# EasyEDA Pro project 6.26TI主控板.epro

# Schematic Schematic1
Board Name: Board1; Create Date: 2025-06-26; Page Name: P1; Project Name: 电赛国赛TI车; Schematic Name: Schematic1; Update Date: 2025-06-26; Company: 嘉立创EDA; Page Size: A4; Version: V1.0
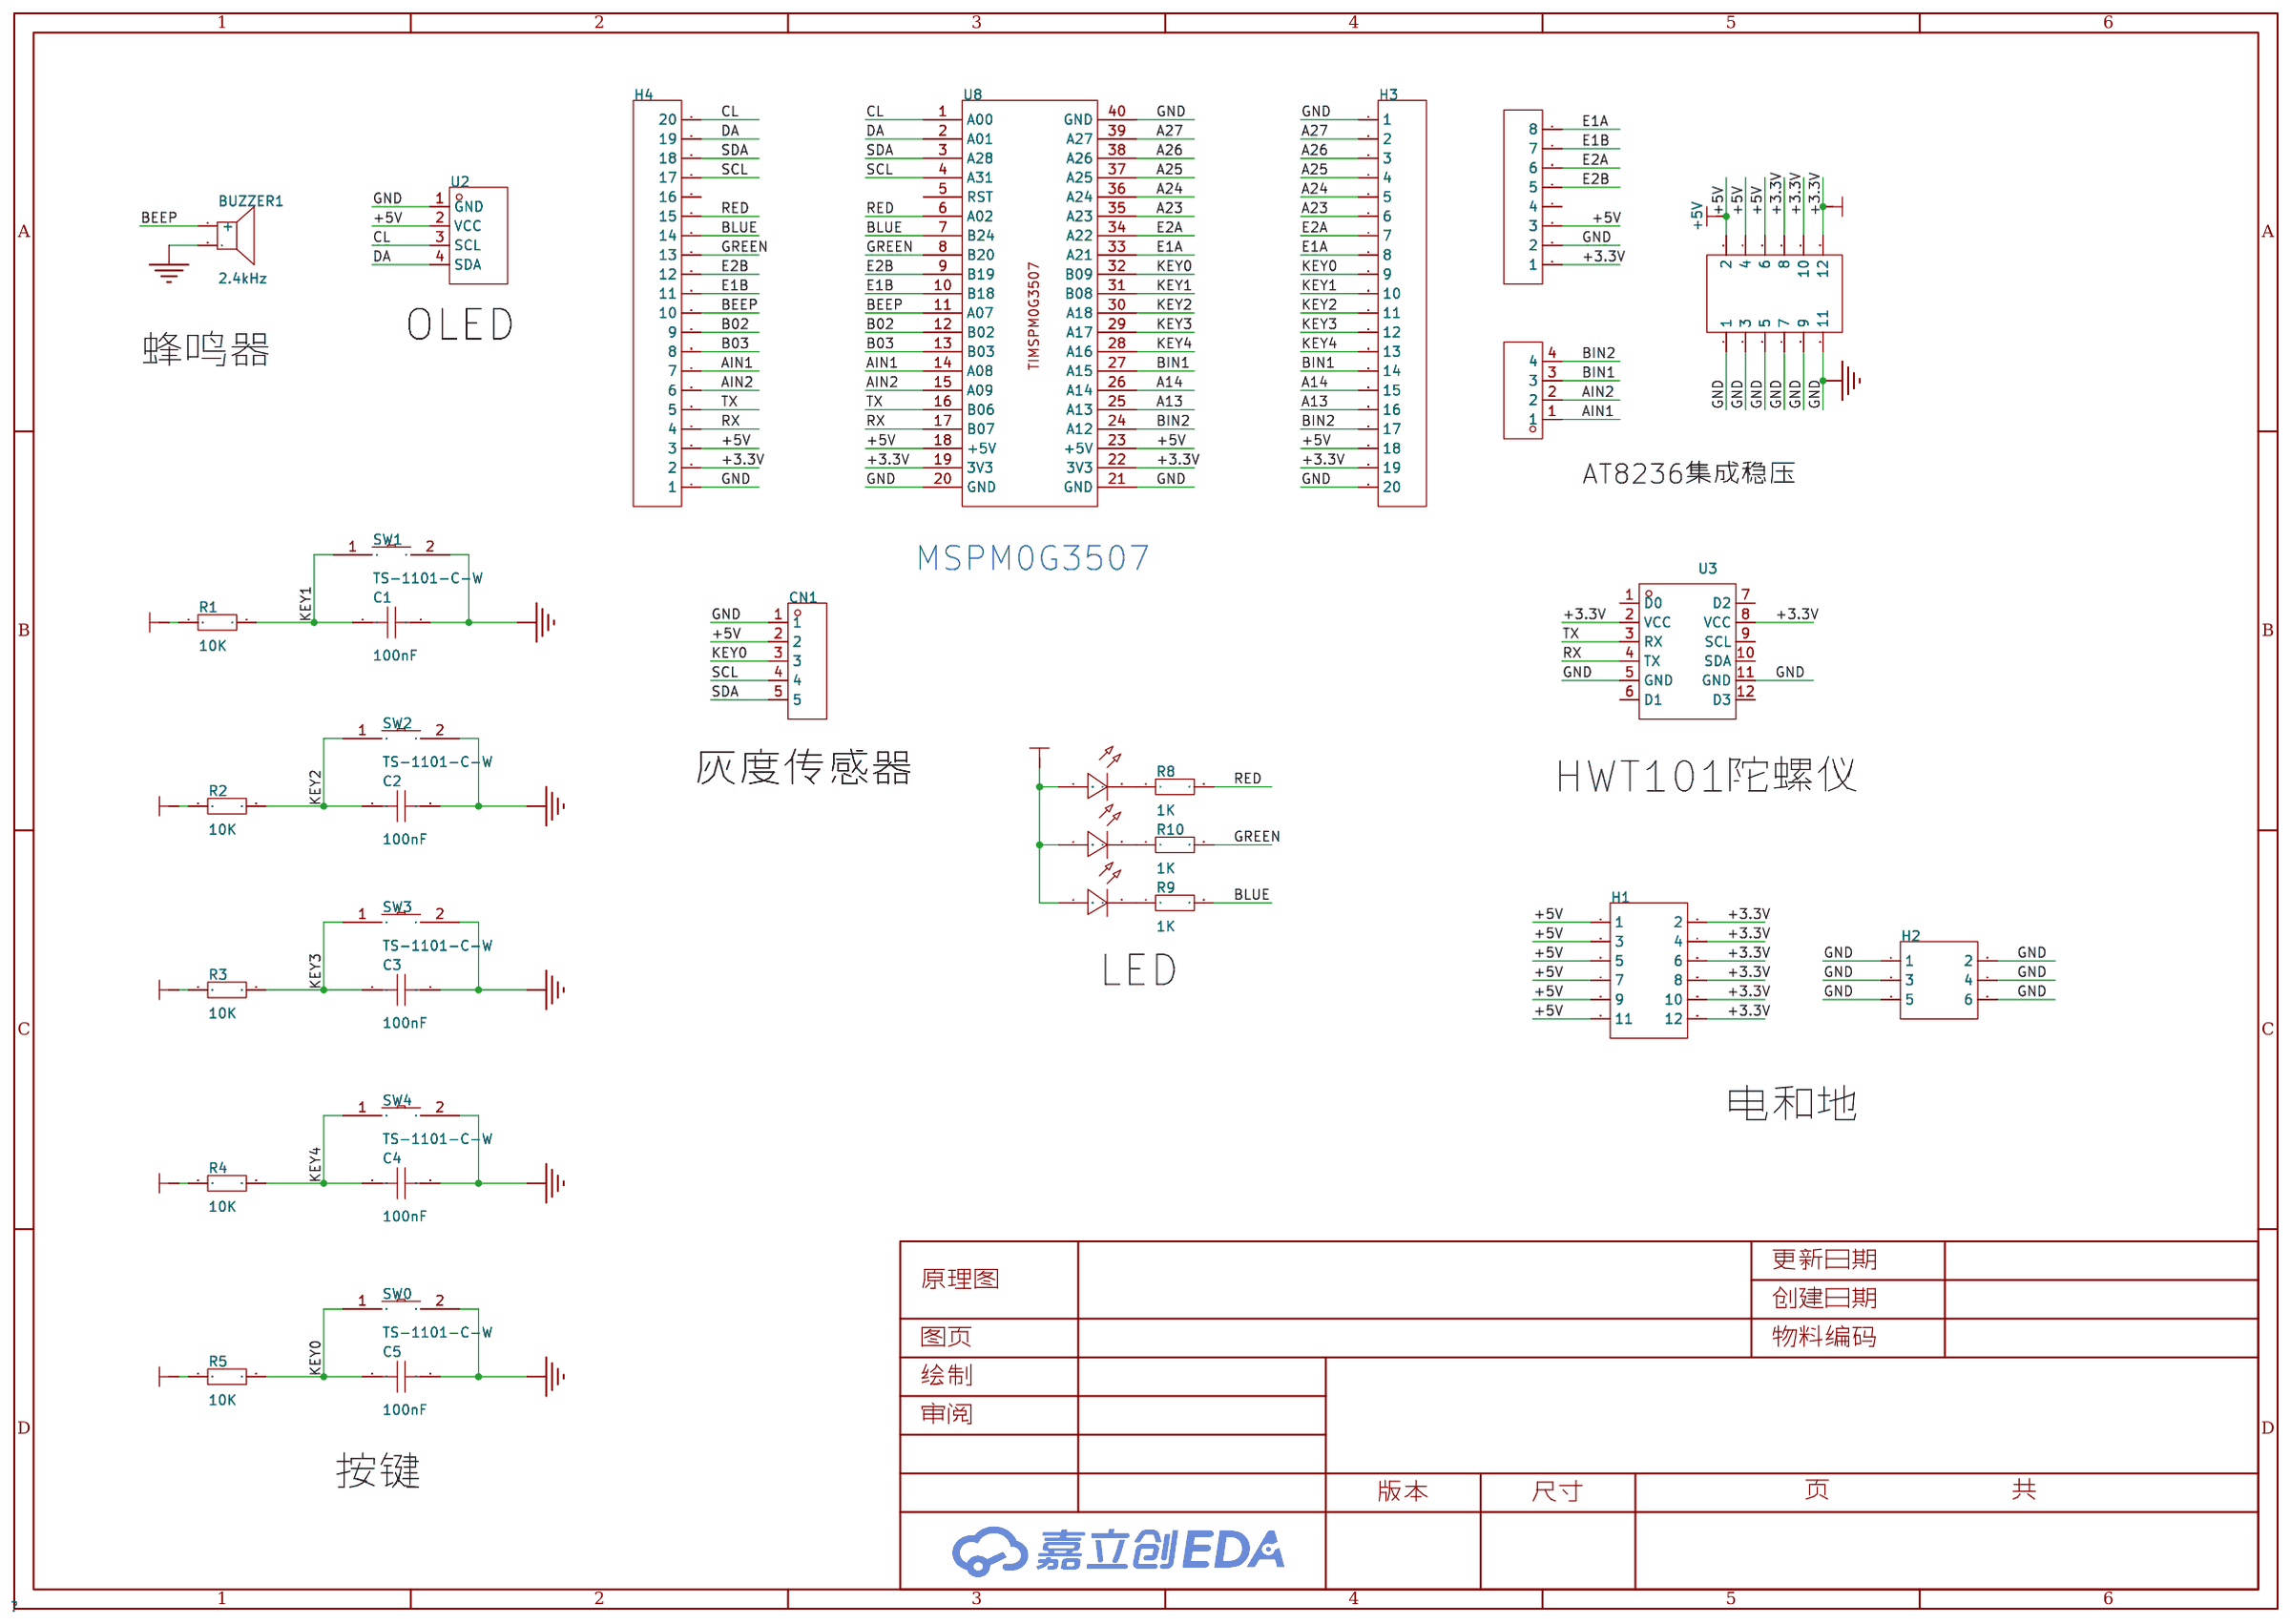
[diagram p0: schematic sheet]

## Parts
AT82361p4  -  [HDR-TH_4P-P2.54-V-F]
AT82362p6  -  [HDR-TH_12P-P2.54-V-M-R2-C6-S2.54]
BUZZER1  2.4kHz  [BUZ-TH_BD12.0-P7.60-D0.6-FD]
C1  100nF  [C0805]
C2  100nF  [C0805]
C3  100nF  [C0805]
C4  100nF  [C0805]
C5  100nF  [C0805]
CN1  灰度传感器  [CONN-TH_5P-P2.54_XH-5AW_C2908614]
H1  -  [HDR-TH_12P-P2.54-V-M-R2-C6-S2.54]
H2  -  [HDR-TH_6P-P2.54-V-F-R2-C3-S2.54]
H3  -  [HDR-TH_20P-P2.54-V-F]
H4  -  [HDR-TH_20P-P2.54-V-F]
LED1  -  [LED_TH-3mm]
LED2  -  [LED_TH-3mm]
LED3  -  [LED_TH-3mm]
R1  10K  [R0805]
R2  10K  [R0805]
R3  10K  [R0805]
R4  10K  [R0805]
R5  10K  [R0805]
R8  1K  [R0805_1]
R9  1K  [R0805_1]
R10  1K  [R0805_1]
SW0  TS-1101-C-W  [SW-SMD_L6.0-W3.3-LS8.0]
SW1  TS-1101-C-W  [SW-SMD_L6.0-W3.3-LS8.0]
SW2  TS-1101-C-W  [SW-SMD_L6.0-W3.3-LS8.0]
SW3  TS-1101-C-W  [SW-SMD_L6.0-W3.3-LS8.0]
SW4  TS-1101-C-W  [SW-SMD_L6.0-W3.3-LS8.0]
U2  OLED  [OLED-TH_L27.8-W27.2-P2.54_C9900033791]
U3  -  [HWT101]
U7  -  [HDR-TH_8P-P2.54-V-F-1]
U8  -  [TIMSPM0G3507-MINI]

## Library data of the parts
AT82361p4 = HDR-F_2.54_1x4P: Supplier Part: C2718488; Supplier Footprint: 插件
AT82362p6 H1 = HDR-F_2.54_2x6
BUZZER1 = TMB12A05_C96093: 驱动方式:有源(内含驱动线路);构造类型:电磁式;额定电压:-;频率:2.4kHz;声压(SPL):85dB;; LCSC Part Name: TMB12A05; Supplier Part: C96093; Manufacturer: 华能; Manufacturer Part: TMB12A05; Supplier Footprint: 插件,D=12mm; JLCPCB Part Class: 扩展库; Datasheet: https://atta.szlcsc.com/upload/public/pdf/source/20241025/8A17FE04D767D19A35A06DEF9A82AB1E.pdf; Supplier: LCSC; Driver Circuitry: 有源(内含驱动线路); Technology: 电磁式; Voltage - Supply: 4V~8V; Sound Pressure Level(SPL): 85dB; Diameter(φD): 12mm; Height: 9.8mm
C1-C5 = CAP_0805: Supplier Footprint: 0805
CN1 = XH-5AW: 插针结构:1x5P;间距:2.54mm;安装方式:弯插;参考系列:XH;总PIN数:5P;排数:1;每排PIN数:5;行距:-;额定电流:3A;触头材质:黄铜;触头镀层:锡;工作温度范围:-25℃~+85℃;; LCSC Part Name: 1x5P 间距:2.54mm 弯插 系列:XH; Supplier Part: C2908614; Manufacturer: HCTL(华灿天禄); Supplier Footprint: 弯插,P=2.5mm; JLCPCB Part Class: 扩展库; Datasheet: https://atta.szlcsc.com/upload/public/pdf/source/20230711/B565BAF3B11666EF6B81B3605408F2BD.pdf; Supplier: LCSC; Pins Structure: 1x5P; Pitch: 2.54mm; Mounting Style: 弯插; Reference Series: XH; Number of Pins: 5P; Number of Rows: 1; Number of PINs Per Row: 5; Current Rating (Max): 3A; Contact Material: 黄铜; Contact Plating: 锡; Operating Temperature Range: -25℃~+85℃
H2 = HDR-F_2.54_2x3: Supplier Part: C92272; Supplier Footprint: 插件
H3 H4 = HDR-F_2.54_1x20P: Supplier Part: C50984; Supplier Footprint: 插件
LED1 = LED_TH-R_3mm: Supplier Footprint: 插件
LED2 = LED_TH-G_3mm: Supplier Footprint: 插件
LED3 = LED_TH-B_3mm: Supplier Footprint: 插件
R1-R5 = Res_0805: Supplier Footprint: 0805
R8-R10 = Res_0603: Supplier Footprint: 0603
SW0-SW4 = TS-1101-C-W: 电路结构:单刀单掷;按钮形状:矩形按钮;作用力:260gf;安装方式:立贴;开关长度:6mm;开关宽度:3.6mm;开关高度:2.5mm;带支架:不带;触点电流:50mA;额定电压(AC):-;额定电压(DC):12V;额定功率:-;绝缘电阻:-;带灯:无;机械寿命:5万次;; LCSC Part Name: 6*3.6*2.5mm 立贴 轻触开关; Supplier Part: C318938; Manufacturer: XKB Connectivity(中国星坤); Supplier Footprint: SMD; JLCPCB Part Class: 扩展库; Datasheet: https://atta.szlcsc.com/upload/public/pdf/source/20200227/C318938_C2E53B1EEDE37D980A33616AC086DE53.pdf; Supplier: LCSC; Circuit: 单刀单掷; Actuator Style: 矩形按钮; Operating Force: 260gf; Mounting Style: 立贴; Switch Length: 6mm; Switch Width: 3.6mm; Switch Height: 2.5mm; Strike Gundam: 不带; Contact Current: 50mA; Voltage Rating (DC): 12V; Actuator/Cap Color: 白色带淡绿; With Lamp: 无; Mechanical Life: 5万次; Operating Temperature: -30℃~+85℃
U2 = HS96L03W2C03: 主控芯片:SSD1315;接口类型:I2C;尺寸(inch):0.96;像素分辨率:128x64;; LCSC Part Name: 0.96寸OLED显示屏窄白光IIC; Supplier Part: C5248080; Manufacturer: HS(汉昇); JLCPCB Part Class: 扩展库; Datasheet: https://atta.szlcsc.com/upload/public/pdf/source/20230627/763D01F79A90007632F098068C7C8AD9.pdf; Supplier: LCSC; Main Control Chip: SSD1315; Interface Type: I2C; Size: 0.96; Pixel Resolution: 128x64; Operating Temperature: -40℃~+70℃
U3 = HWT101: Pin Type: IN
U7 = HDR-F_2.54_1x8P: Supplier Part: C27438; Supplier Footprint: 插件
U8 = TIMSPM0G3507 地猛星: TI控制板卡，MSPM0G3507-地猛星

## Nets
+3.3V: AT82362p6.8 AT82362p6.10 AT82362p6.12 H1.2 H1.4 H1.6 H1.8 H1.10 H1.12 H3.19 H4.2 LED1.1(C) LED2.1(C) LED3.1(C) R1.1 R2.1 R3.1 R4.1 R5.1 U3.2(VCC) U3.8(VCC) U7.1 U8.19(3V3) U8.22(3V3)
+5V: AT82362p6.2 AT82362p6.4 AT82362p6.6 CN1.2 H1.1 H1.3 H1.5 H1.7 H1.9 H1.11 H3.18 H4.3 U2.2(VCC) U7.3 U8.18(+5V) U8.23(+5V)
GND: AT82362p6.1 AT82362p6.3 AT82362p6.5 AT82362p6.7 AT82362p6.9 AT82362p6.11 BUZZER1.2 C1.2 C2.2 C3.2 C4.2 C5.2 CN1.1 H2.1 H2.2 H2.3 H2.4 H2.5 H2.6 H3.1 H3.20 H4.1 SW0.2 SW1.2 SW2.2 SW3.2 SW4.2 U2.1(GND) U3.5(GND) U3.11(GND) U7.2 U8.20(GND) U8.21(GND) U8.40(GND)
A13: H3.16 U8.25(A13)
A14: H3.15 U8.26(A14)
A23: H3.6 U8.35(A23)
A24: H3.5 U8.36(A24)
A25: H3.4 U8.37(A25)
A26: H3.3 U8.38(A26)
A27: H3.2 U8.39(A27)
AIN1: AT82361p4.1 H4.7 U8.14(A08)
AIN2: AT82361p4.2 H4.6 U8.15(A09)
B02: H4.9 U8.12(B02)
B03: H4.8 U8.13(B03)
BEEP: BUZZER1.1(+) H4.10 U8.11(A07)
BIN1: AT82361p4.3 H3.14 U8.27(A15)
BIN2: AT82361p4.4 H3.17 U8.24(A12)
BLUE: H4.14 R9.2 U8.7(B24)
CL: H4.20 U2.3(SCL) U8.1(A00)
DA: H4.19 U2.4(SDA) U8.2(A01)
E1A: H3.8 U7.8 U8.33(A21)
E1B: H4.11 U7.7 U8.10(B18)
E2A: H3.7 U7.6 U8.34(A22)
E2B: H4.12 U7.5 U8.9(B19)
GREEN: H4.13 R10.2 U8.8(B20)
KEY0: C5.1 CN1.3 H3.9 R5.2 SW0.1 U8.32(B09)
KEY1: C1.1 H3.10 R1.2 SW1.1 U8.31(B08)
KEY2: C2.1 H3.11 R2.2 SW2.1 U8.30(A18)
KEY3: C3.1 H3.12 R3.2 SW3.1 U8.29(A17)
KEY4: C4.1 H3.13 R4.2 SW4.1 U8.28(A16)
RED: H4.15 R8.2 U8.6(A02)
RX: H4.4 U3.4(TX) U8.17(B07)
SCL: CN1.4 H4.17 U8.4(A31)
SDA: CN1.5 H4.18 U8.3(A28)
TX: H4.5 U3.3(RX) U8.16(B06)
Net-(LED1-2): LED1.2(A) R8.1
Net-(LED2-2): LED2.2(A) R10.1
Net-(LED3-2): LED3.2(A) R9.1

Not connected (* = marked no-connect by the designer): H4 16; U3 1(D0) 6(D1) 7(D2) 9(SCL) 10(SDA) 12(D3); U7 4; U8 5(RST)

## Notes on the sheet
- 蜂鸣器
- AT8236集成稳压
- MSPM0G3507
- HWT101陀螺仪
- LED
- 电和地
- 按键

# Board PCB1
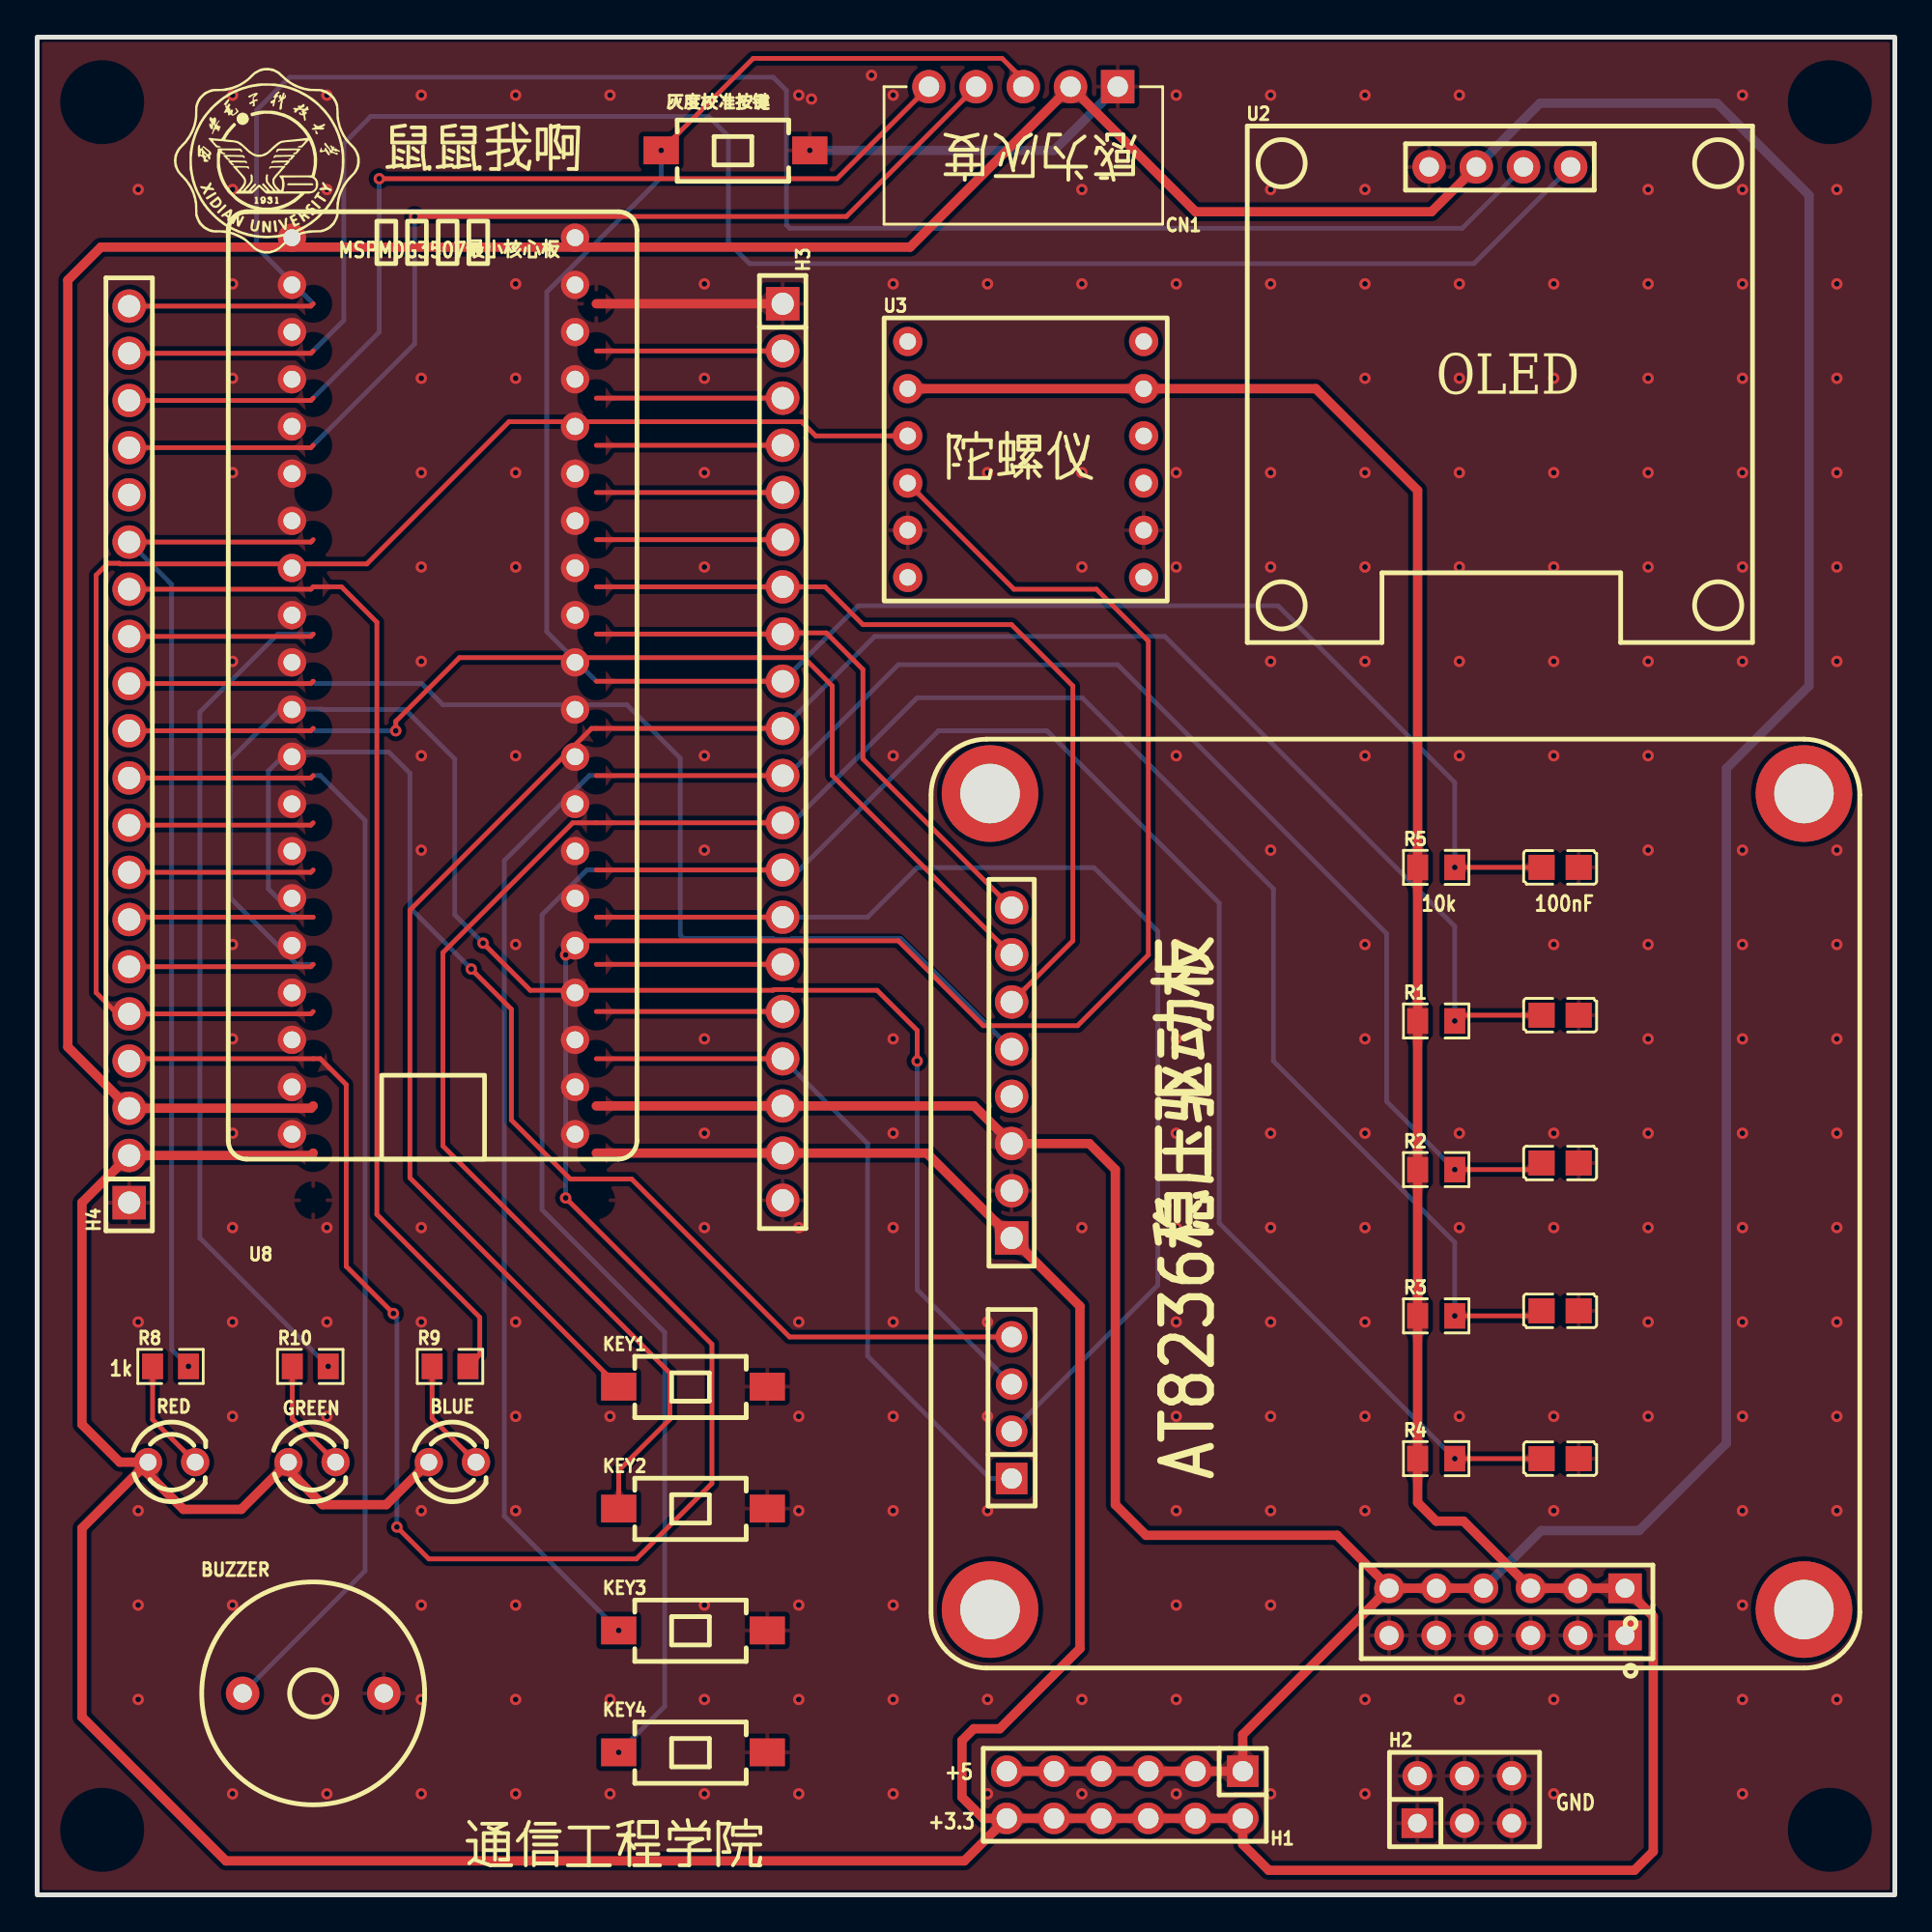
[diagram p1: board, top side]
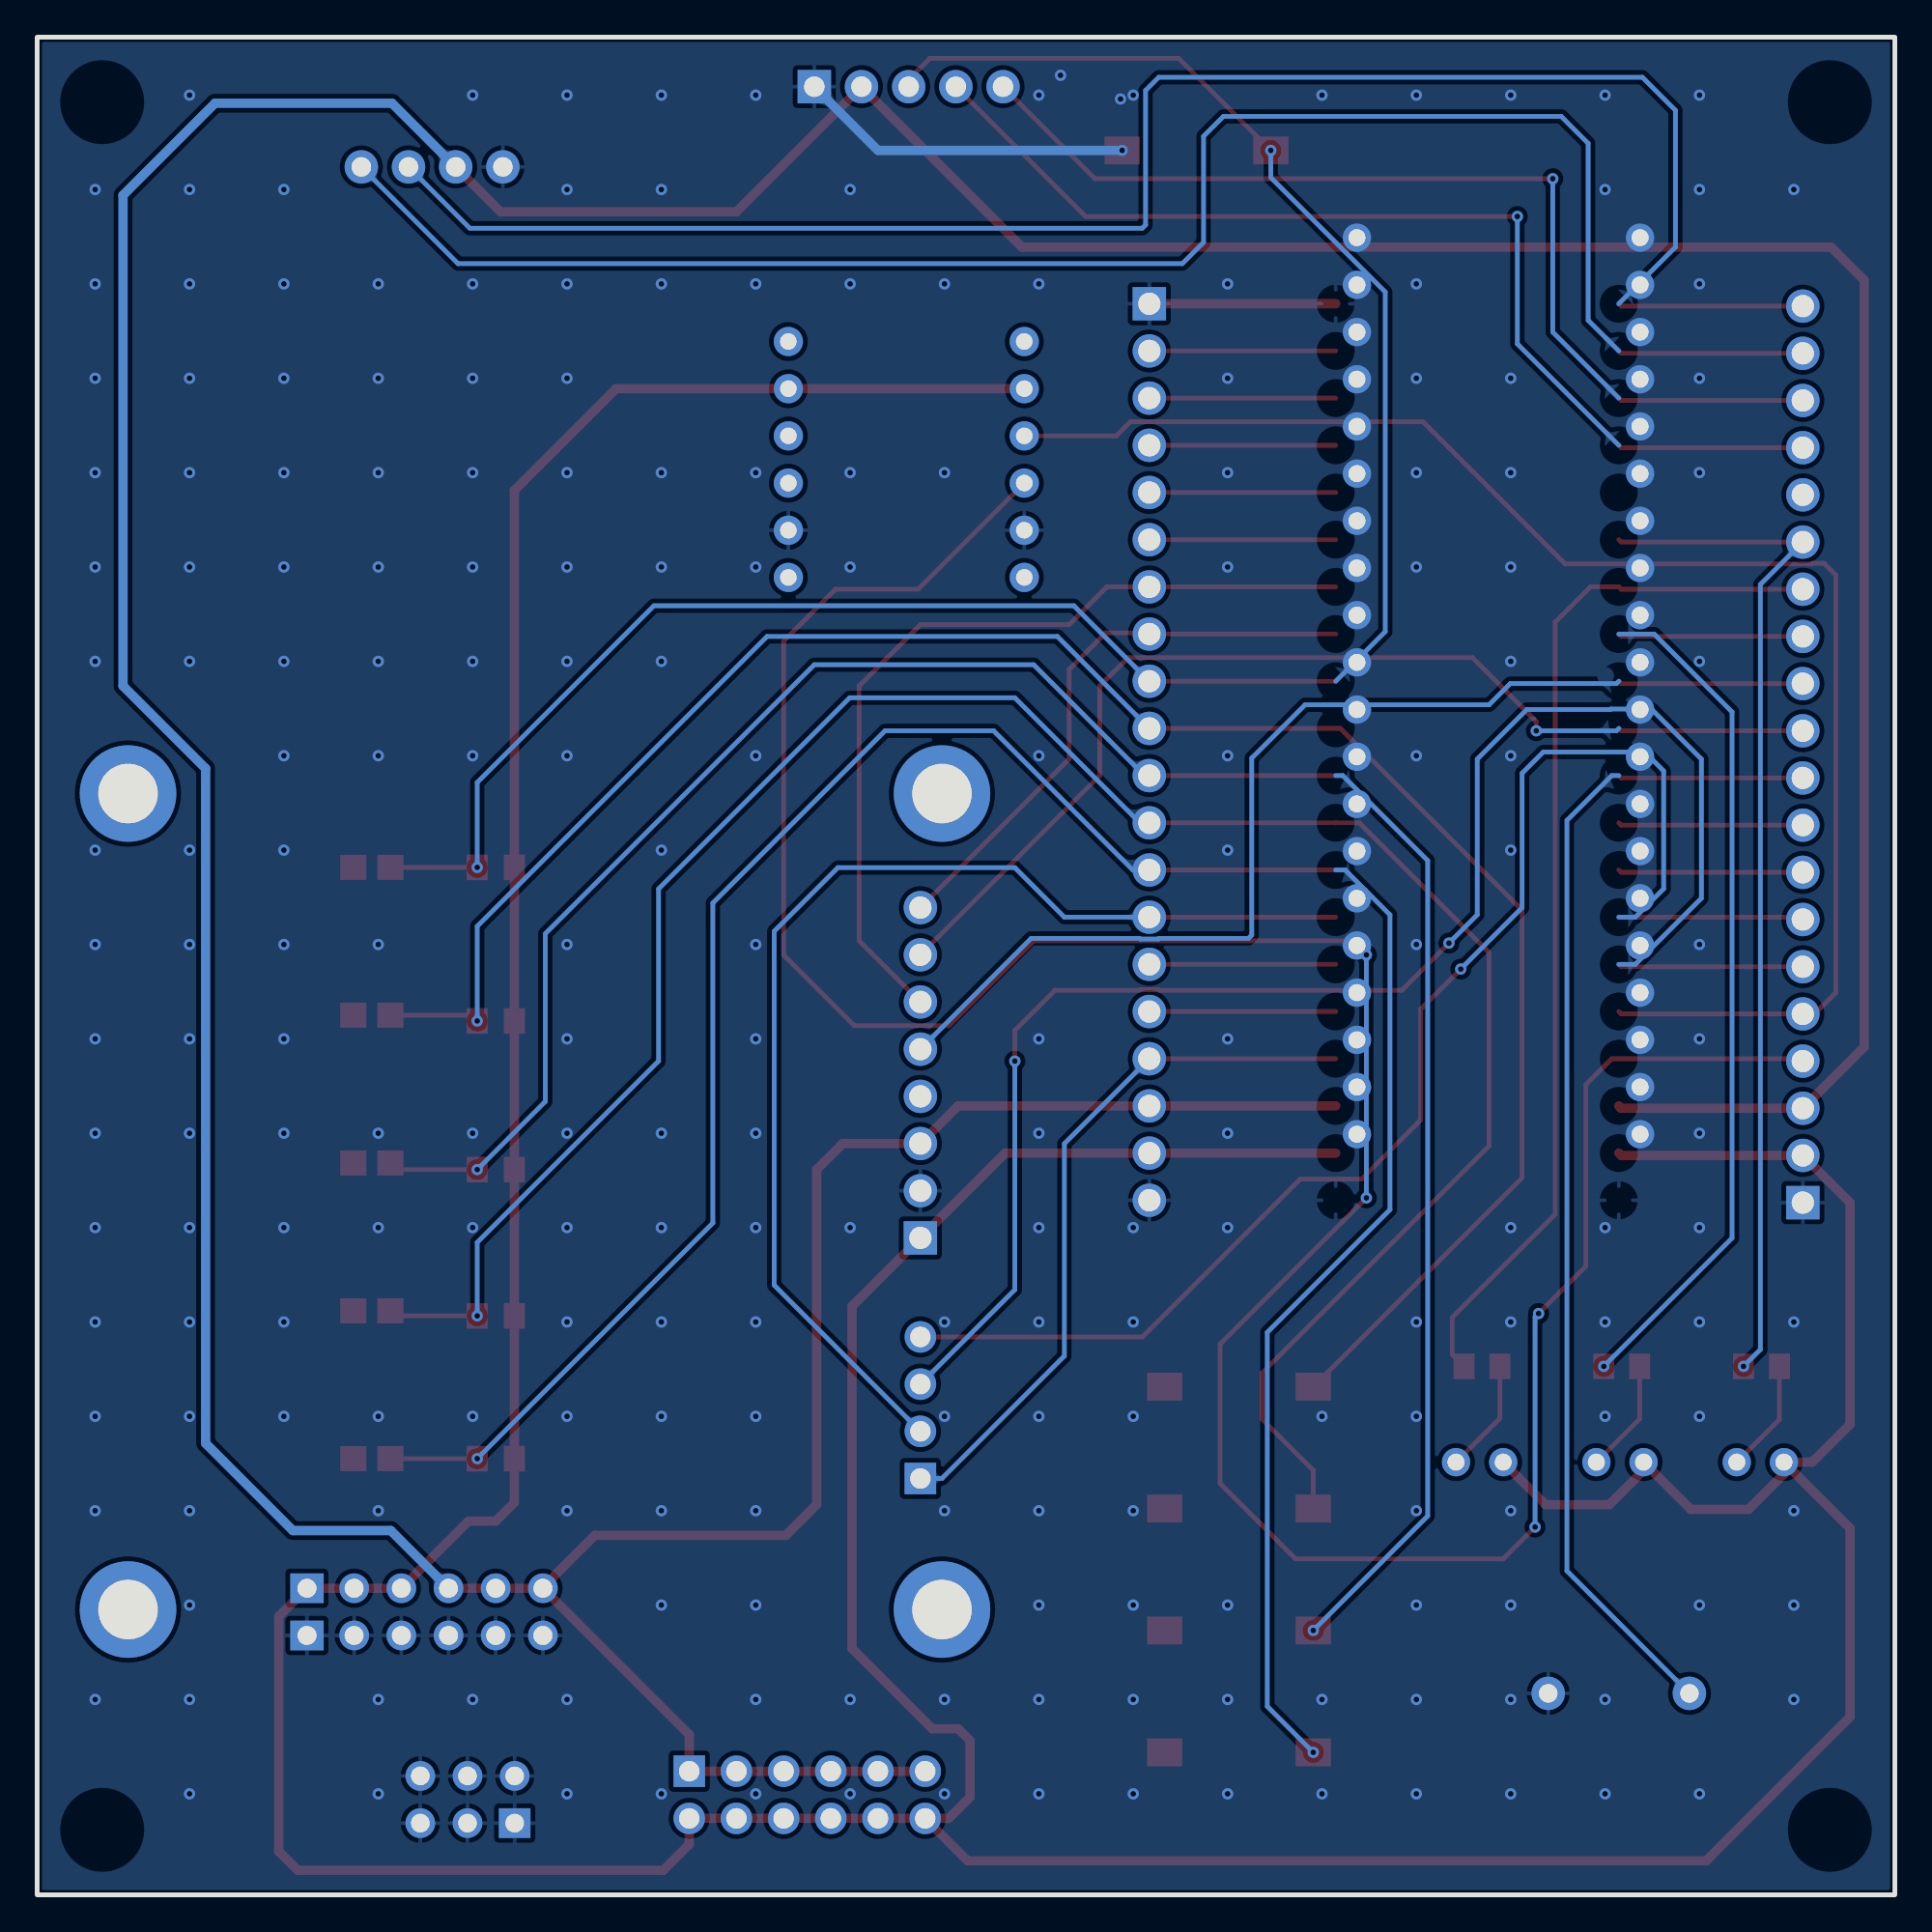
[diagram p2: board, bottom side, seen from below]

Outline 100 x 100 mm; copper layers: Top Layer, Bottom Layer. Coordinates in mm from the lower left corner of the outline.
Outline path: rectangle 0,100 100,0
Stack: Top Layer 0.035mm / Dielectric1 1.51mm FR4 er 4.5 / Bottom Layer 0.035mm

## Design rules (mm)
template: JLCPCB Capability(Two Layers Board)
spacing copperThickness1oz (default): track to track 0.102, other pairs 0.152 to 0.3
spacing copperThickness2oz: track to track 0.203, other pairs 0.152 to 0.3
track width copperThickness1oz (default): min 0.127, default 0.254, max 2.54
track width copperThickness2oz: min 0.203, default 0.254, max 2.54
differential pair differentialPair (default): width min 0.127, default 0.254, max 2.54; gap min 0.152, default 0.152
via viaSize (default): diameter min 0.5, default 0.61, max 10; hole min 0.3, default 0.305, max 6.3

## Placement (name value [footprint] x y rotation side)
BLUE  -  [LED_TH-3mm]  22.35 23.29 0 top
BUZZER  2.4kHz  [BUZ-TH_BD12.0-P7.60-D0.6-FD]  14.86 10.85 0 top
C1  100nF  [C0805]  81.98 47.35 0 top
C2  100nF  [C0805]  81.98 39.39 0 top
C3  100nF  [C0805]  81.98 31.44 0 top
C4  100nF  [C0805]  81.98 23.48 0 top
C5  100nF  [C0805]  81.98 55.31 0 top
CN1  灰度传感器  [CONN-TH_5P-P2.54_XH-5AW_C2908614]  53.09 97.33 180 top
GREEN  -  [LED_TH-3mm]  14.8 23.29 0 top
H1  -  [HDR-TH_12P-P2.54-V-M-R2-C6-S2.54]  58.55 5.38 180 top
H2  -  [HDR-TH_6P-P2.54-V-F-R2-C3-S2.54]  76.84 5.13 0 top
H3  -  [HDR-TH_20P-P2.54-V-F]  40.13 61.52 270 top
H4  -  [HDR-TH_20P-P2.54-V-F]  4.95 61.39 90 top
H20  -  [HDR-TH_8P-P2.54-V-F-1]  52.46 44.25 90 top
H21  -  [HDR-TH_4P-P2.54-V-F]  52.46 26.22 90 top
H22  -  [HDR-TH_6P-P2.54-V-F]  79.13 13.96 180 top
H23  -  [HDR-TH_6P-P2.54-V-F]  79.13 16.5 180 top
KEY1  TS-1101-C-W  [SW-SMD_L6.0-W3.3-LS8.0]  35.31 27.36 0 top
KEY2  TS-1101-C-W  [SW-SMD_L6.0-W3.3-LS8.0]  35.31 20.79 0 top
KEY3  TS-1101-C-W  [SW-SMD_L6.0-W3.3-LS8.0]  35.31 14.23 0 top
KEY4  TS-1101-C-W  [SW-SMD_L6.0-W3.3-LS8.0]  35.31 7.67 0 top
R1  10K  [R0805]  75.31 47.04 0 top
R2  10K  [R0805]  75.31 39.04 0 top
R3  10K  [R0805]  75.31 31.17 0 top
R4  10K  [R0805]  75.31 23.48 0 top
R5  10K  [R0805]  75.31 55.31 0 top
R8  1K  [R0805_1]  7.18 28.45 0 top
R9  1K  [R0805_1]  22.22 28.45 0 top
R10  1K  [R0805_1]  14.7 28.45 0 top
RED  -  [LED_TH-3mm]  7.24 23.29 0 top
SCREW3  -  [M3螺丝]  95.11 59.28 90 top
SCREW5  -  [M3螺丝]  95.11 15.36 90 top
SCREW6  -  [M3螺丝]  51.29 59.28 90 top
SCREW7  -  [M3螺丝]  51.29 15.36 90 top
U2  OLED  [OLED-TH_L27.8-W27.2-P2.54_C9900033791]  78.74 93.02 0 top
U3  -  [HWT101]  53.21 77.27 0 top
U8  -  [TIMSPM0G3507-MINI]  22.48 61.52 0 top
灰度校准按键  TS-1101-C-W  [SW-SMD_L6.0-W3.3-LS8.0]  37.59 93.9 0 top

## Footprints (pads in the part's own frame, mm; a bottom-side part is the same pattern mirrored in y, then rotated)
BUZ-TH_BD12.0-P7.60-D0.6-FD
  round 1.8 hole 1: 1(-3.8,0) 2(3.8,0)
C0805
  rect 1.41x1.35 smd: 1(-1,0) 2(1,0)
CONN-TH_5P-P2.54_XH-5AW_C2908614
  rect 1.8x1.8 hole 1.1: 1(-5.08,0)
  round 1.8 hole 1.1: 2(-2.54,0) 3(0,0) 4(2.54,0) 5(5.08,0)
HDR-TH_4P-P2.54-V-F
  rect 1.7x1.7 hole 1.1: 1(-3.81,0)
  round 1.7 hole 1.1: 2(-1.27,0) 3(1.27,0) 4(3.81,0)
HDR-TH_6P-P2.54-V-F
  rect 1.8x1.6 hole 1.02: 1(-6.35,0)
  round 1.6 hole 1.02: 2(-3.81,0) 3(-1.27,0) 4(1.27,0) 5(3.81,0) 6(6.35,0)
HDR-TH_6P-P2.54-V-F-R2-C3-S2.54
  rect 1.7x1.6 hole 1: 1(-2.54,-1.27)
  round 1.6 hole 1: 2(-2.54,1.27) 3(0,-1.27) 4(0,1.27) 5(2.54,-1.27) 6(2.54,1.27)
HDR-TH_8P-P2.54-V-F-1
  rect 1.8x1.8 hole 1.2: 1(-8.89,0)
  round 1.8 hole 1.2: 2(-6.35,0) 3(-3.81,0) 4(-1.27,0) 5(1.27,0) 6(3.81,0) 7(6.35,0) 8(8.89,0)
HDR-TH_12P-P2.54-V-M-R2-C6-S2.54
  rect 1.7x1.7 hole 1.1: 1(-6.35,-1.27)
  round 1.7 hole 1.1: 2(-6.35,1.27) 3(-3.81,-1.27) 4(-3.81,1.27) 5(-1.27,-1.27) 6(-1.27,1.27) 7(1.27,-1.27) 8(1.27,1.27) 9(3.81,-1.27) 10(3.81,1.27) 11(6.35,-1.27) 12(6.35,1.27)
HDR-TH_20P-P2.54-V-F
  rect 1.8x1.8 hole 1.2: 1(-24.13,0)
  round 1.8 hole 1.2: 2(-21.59,0) 3(-19.05,0) 4(-16.51,0) 5(-13.97,0) 6(-11.43,0) 7(-8.89,0) 8(-6.35,0) 9(-3.81,0) 10(-1.27,0) 11(1.27,0) 12(3.81,0) 13(6.35,0) 14(8.89,0) 15(11.43,0) 16(13.97,0) 17(16.51,0) 18(19.05,0) 19(21.59,0) 20(24.13,0)
HWT101
  round 1.575 hole 0.889: 1(-6.35,6.35) 2(-6.35,3.81) 3(-6.35,1.27) 4(-6.35,-1.27) 5(-6.35,-3.81) 6(-6.35,-6.35) 7(6.35,6.35) 8(6.35,3.81) 9(6.35,1.27) 10(6.35,-1.27) 11(6.35,-3.81) 12(6.35,-6.35)
LED_TH-3mm
  round 1.524 hole 0.914: 1(-1.27,0) 2(1.27,0)
M3螺丝
  round 5.2 hole 3.2: 1(0,0)
OLED-TH_L27.8-W27.2-P2.54_C9900033791
  round 1.8 hole 1.05: 1(-3.81,0) 2(-1.27,0) 3(1.27,0) 4(3.81,0)
R0805
  rect 1.133x1.377 smd: 1(-1,0) 2(1,0)
R0805_1
  rect 1.133x1.377 smd: 1(-0.966,0) 2(0.966,0)
SW-SMD_L6.0-W3.3-LS8.0
  rect 1.9x1.5 smd: 1(-4,0) 2(4,0)
TIMSPM0G3507-MINI
  round 1.524 hole 0.914: 1(-8.763,27.686) 2(-8.763,25.146) 3(-8.763,22.606) 4(-8.763,20.066) 5(-8.763,17.526) 6(-8.763,14.986) 7(-8.763,12.446) 8(-8.763,9.906) 9(-8.763,7.366) 10(-8.763,4.826) 11(-8.763,2.286) 12(-8.763,-0.254) 13(-8.763,-2.794) 14(-8.763,-5.334) 15(-8.763,-7.874) 16(-8.763,-10.414) 17(-8.763,-12.954) 18(-8.763,-15.494) 19(-8.763,-18.034) 20(-8.763,-20.574) 21(6.477,-20.574) 22(6.477,-18.034) 23(6.477,-15.494) 24(6.477,-12.954) 25(6.477,-10.414) 26(6.477,-7.874) 27(6.477,-5.334) 28(6.477,-2.794) 29(6.477,-0.254) 30(6.477,2.286) 31(6.477,4.826) 32(6.477,7.366) 33(6.477,9.906) 34(6.477,12.446) 35(6.477,14.986) 36(6.477,17.526) 37(6.477,20.066) 38(6.477,22.606) 39(6.477,25.146) 40(6.477,27.686)

## Nets
+3.3V: BLUE.1 GREEN.1 H1.2 H1.4 H1.6 H1.8 H1.10 H1.12 H3.19 H4.2 H20.1 H23.1 H23.2 H23.3 R1.1 R2.1 R3.1 R4.1 R5.1 RED.1 U3.2 U3.8 U8.19 U8.22
+5V: CN1.2 H1.1 H1.3 H1.5 H1.7 H1.9 H1.11 H3.18 H4.3 H20.3 H23.4 H23.5 H23.6 U2.2 U8.18 U8.23
GND: BUZZER.2 C1.2 C2.2 C3.2 C4.2 C5.2 CN1.1 H2.1 H2.2 H2.3 H2.4 H2.5 H2.6 H3.1 H3.20 H4.1 H20.2 H22.1 H22.2 H22.3 H22.4 H22.5 H22.6 KEY1.2 KEY2.2 KEY3.2 KEY4.2 U2.1 U3.5 U3.11 U8.20 U8.21 U8.40 灰度校准按键.2
A23: H3.6 U8.35
A24: H3.5 U8.36
A25: H3.4 U8.37
A26: H3.3 U8.38
A27: H3.2 U8.39
AIN1: H4.7 H21.4 U8.14
AIN2: H4.6 H21.3 U8.15
B02: H4.9 U8.12
B03: H4.8 U8.13
BEEP: BUZZER.1 H4.10 U8.11
BIN1: H3.14 H21.2 U8.27
BIN2: H3.17 H21.1 U8.24
BLUE: H4.14 R9.2 U8.7
CL: H4.20 U2.3 U8.1
DA: H4.19 U2.4 U8.2
E1A: H3.8 H20.8 U8.33
E1B: H4.11 H20.7 U8.10
E2A: H3.7 H20.6 U8.34
E2B: H4.12 H20.5 U8.9
GREEN: H4.13 R10.2 U8.8
KEY0: C5.1 CN1.3 H3.9 R5.2 U8.32 灰度校准按键.1
KEY1: C1.1 H3.10 KEY1.1 R1.2 U8.31
KEY2: C2.1 H3.11 KEY3.1 R2.2 U8.30
KEY3: C3.1 H3.12 KEY2.1 R3.2 U8.29
KEY4: C4.1 H3.13 KEY4.1 R4.2 U8.28
RED: H4.15 R8.2 U8.6
RX: H4.4 U3.4 U8.17
SCL: CN1.4 H4.17 U8.4
SDA: CN1.5 H4.18 U8.3
TX: H4.5 U3.3 U8.16
$1N1882: R8.1 RED.2
$1N1885: BLUE.2 R9.1
$1N1887: GREEN.2 R10.1

Pads without a net: H3 15 16; H4 16; H20 4; SCREW3 1; SCREW5 1; SCREW6 1; SCREW7 1; U3 1 6 7 9 10 12; U8 5 25 26

## Via types
v1: diameter 0.61, hole 0.305, Top Layer to Bottom Layer, 242 vias

## Routing (per net, layer and track width the routed paths; a pad name or vN(x,y) marks a point on that pad's centre or on a via; arc(x,y) is an arc through that point)
+3.3V: length 330.2
  Top Layer w0.5: 52.2,4.12 50.93,4.12 49.78,5.26 49.78,8.31 50.42,8.94 51.82,8.94 56.13,13.26 56.13,31.68 H20.1 47.89,39.93 H3.19 30.1,39.93 ; 52.2,4.12 64.9,4.12 64.9,2.72 66.29,1.32 85.98,1.32 87,2.34 87,14.98 H23.1 H23.2 H23.3 76.78,20.12 75.31,20.12 74.31,21.12 R4.1 R3.1 R2.1 R1.1 R5.1 74.31,75.6 68.83,81.08 U3.8 U3.2 ; 52.2,4.12 49.91,1.83 10.16,1.83 2.41,9.58 2.41,19.74 5.97,23.29 ; 5.97,23.29 5.97,22.66 7.87,20.75 10.99,20.75 GREEN.1 13.53,22.85 15.37,21.01 18.8,21.01 BLUE.1 ; 5.97,23.29 4.44,23.29 2.41,25.32 2.41,37.26 H4.2 14.73,39.8 14.86,39.93
+5V: length 341.2
  Top Layer w0.5: H1.11 H1.9 H1.7 H1.5 H1.3 H1.1 64.9,8.62 H23.6 H23.5 H23.4 ; 14.86,42.47 14.73,42.34 H4.3 1.65,45.64 1.65,86.92 3.43,88.7 46.99,88.7 CN1.2 62.36,90.6 75.06,90.6 U2.2 ; 72.64,16.69 69.98,19.35 59.69,19.35 58.04,21.01 58.04,39.04 56.64,40.44 H20.3 50.43,42.47 30.1,42.47
  Bottom Layer w0.5: H23.4 80.96,19.61 86.23,19.61 90.93,24.31 90.93,60.63 95.38,65.08 95.38,91.49 90.42,96.44 80.9,96.44 U2.2
GND: length 28
  Top Layer w0.5: H3.1 30.1,85.65
  Bottom Layer w0.5: v1(41.59,93.9) 54.74,93.9 CN1.1
  vias: v1(5.44,91.8) v1(5.44,30.84) v1(5.44,20.68) v1(5.44,15.6) v1(5.44,10.52) v1(10.52,96.88) v1(10.52,91.8) v1(10.52,86.72) v1(10.52,81.64) v1(10.52,76.56) v1(10.52,66.4) v1(10.52,51.16) v1(10.52,46.08) v1(10.52,41) v1(10.52,35.92) v1(10.52,30.84) v1(10.52,25.76) v1(10.52,15.6) v1(10.52,5.44) v1(15.6,96.88) v1(15.6,91.8) v1(15.6,35.92) v1(15.6,30.84) v1(15.6,25.76) v1(15.6,10.52) v1(15.6,5.44) v1(20.68,96.88) v1(20.68,81.64) v1(20.68,76.56) v1(20.68,71.48) v1(20.68,66.4) v1(20.68,61.32) v1(20.68,56.24) v1(20.68,35.92) v1(20.68,30.84) v1(20.68,20.68) v1(20.68,15.6) v1(20.68,10.52) v1(20.68,5.44) v1(25.76,96.88) v1(25.76,86.72) v1(25.76,81.64) v1(25.76,76.56) v1(25.76,71.48) v1(25.76,61.32) v1(25.76,51.16) v1(25.76,30.84) v1(25.76,25.76) v1(25.76,20.68) v1(25.76,15.6) v1(25.76,10.52) v1(25.76,5.44) v1(30.84,96.88) v1(30.84,25.76) v1(30.84,10.52) v1(30.84,5.44) v1(35.92,86.72) v1(35.92,81.64) v1(35.92,76.56) v1(35.92,71.48) v1(35.92,61.32) v1(35.92,56.24) v1(35.92,46.08) v1(35.92,41) v1(35.92,35.92) v1(35.92,15.6) v1(35.92,10.52) v1(35.92,5.44) v1(41,96.88) v1(41,35.92) v1(41,30.84) v1(41,25.76) v1(41,20.68) v1(41,15.6) v1(41,10.52) v1(41,5.44) v1(41.68,96.67) v1(44.91,97.94) v1(46.08,96.88) v1(46.08,86.72) v1(46.08,61.32) v1(46.08,46.08) v1(46.08,41) v1(46.08,35.92) v1(46.08,30.84) v1(46.08,25.76) v1(46.08,20.68) v1(46.08,15.6) v1(46.08,10.52) v1(46.08,5.44) v1(51.16,86.72) v1(51.16,76.56) v1(51.16,30.84) v1(51.16,25.76) v1(51.16,20.68) v1(51.16,10.52) v1(51.16,5.44) v1(56.24,91.8) v1(56.24,86.72) v1(56.24,76.56) v1(56.24,71.48) v1(56.24,35.92) v1(56.24,10.52) v1(56.24,5.44) v1(61.32,96.88) v1(61.32,86.72) v1(61.32,76.56) v1(61.32,71.48) v1(61.32,61.32) v1(61.32,51.16) v1(61.32,46.08) v1(61.32,41) v1(61.32,35.92) v1(61.32,30.84) v1(61.32,25.76) v1(61.32,20.68) v1(61.32,15.6) v1(61.32,10.52) v1(61.32,5.44) v1(66.4,96.88) v1(66.4,91.8) v1(66.4,86.72) v1(66.4,76.56) v1(66.4,71.48) v1(66.4,66.4) v1(66.4,56.24) v1(66.4,41) v1(66.4,35.92) v1(66.4,30.84) v1(66.4,25.76) v1(66.4,20.68) v1(66.4,15.6) v1(66.4,5.44) v1(71.48,96.88) v1(71.48,91.8) v1(71.48,86.72) v1(71.48,81.64) v1(71.48,76.56) v1(71.48,71.48) v1(71.48,66.4) v1(71.48,61.32) v1(71.48,51.16) v1(71.48,46.08) v1(71.48,41) v1(71.48,35.92) v1(71.48,30.84) v1(71.48,25.76) v1(71.48,20.68) v1(71.48,10.52) v1(71.48,5.44) v1(76.56,96.88) v1(76.56,86.72) v1(76.56,81.64) v1(76.56,76.56) v1(76.56,71.48) v1(76.56,66.4) v1(76.56,61.32) v1(76.56,41) v1(76.56,35.92) v1(76.56,25.76) v1(76.56,10.52) v1(81.64,86.72) v1(81.64,81.64) v1(81.64,76.56) v1(81.64,71.48) v1(81.64,66.4) v1(81.64,61.32) v1(81.64,51.16) v1(81.64,41) v1(81.64,35.92) v1(81.64,25.76) v1(81.64,20.68) v1(81.64,10.52) v1(81.64,5.44) v1(86.72,91.8) v1(86.72,86.72) v1(86.72,81.64) v1(86.72,76.56) v1(86.72,71.48) v1(86.72,66.4) v1(86.72,61.32) v1(86.72,56.24) v1(86.72,51.16) v1(86.72,46.08) v1(86.72,41) v1(86.72,35.92) v1(86.72,30.84) v1(86.72,25.76) v1(91.8,96.88) v1(91.8,91.8) v1(91.8,86.72) v1(91.8,81.64) v1(91.8,76.56) v1(91.8,71.48) v1(91.8,66.4) v1(91.8,56.24) v1(91.8,51.16) v1(91.8,46.08) v1(91.8,41) v1(91.8,35.92) v1(91.8,30.84) v1(91.8,25.76) v1(91.8,20.68) v1(91.8,15.6) v1(91.8,10.52) v1(91.8,5.44) v1(96.88,91.8) v1(96.88,86.72) v1(96.88,81.64) v1(96.88,76.56) v1(96.88,71.48) v1(96.88,66.4) v1(96.88,56.24) v1(96.88,51.16) v1(96.88,46.08) v1(96.88,41) v1(96.88,35.92) v1(96.88,30.84) v1(96.88,25.76) v1(96.88,20.68) v1(96.88,10.52)
(no net): length 20.1
  Top Layer w0.254: 30.1,47.55 H3.16 ; H3.15 30.1,50.09
A23: length 10
  Top Layer w0.254: 40.13,72.95 30.1,72.95
A24: length 10
  Top Layer w0.254: 30.1,75.49 H3.5
A25: length 10
  Top Layer w0.254: 40.13,78.03 30.1,78.03
A26: length 10
  Top Layer w0.254: H3.3 30.1,80.57
A27: length 10
  Top Layer w0.254: 30.1,83.11 40.13,83.11
AIN1: length 80.6
  Top Layer w0.254: H21.4 40.5,30.03 32,38.53 28.7,38.53 25.53,41.71 25.53,47.68 v1(23.37,49.83) ; H4.7 5.08,52.63 14.86,52.63
  Bottom Layer w0.254: v1(23.37,49.83) 20.07,53.14 20.07,60.38 18.92,61.52 13.46,61.52 12.45,60.5 12.45,54.15 13.97,52.63 14.86,52.63
AIN2: length 94.7
  Top Layer w0.254: v1(47.37,44.88) 47.37,46.53 45.21,48.69 40.66,48.69 40.62,48.73 39.64,48.73 39.61,48.69 26.54,48.69 v1(24,51.23) ; H4.6 14.73,49.96 14.86,50.09
  Bottom Layer w0.254: 14.86,50.09 13.97,50.09 10.41,53.64 10.41,61.14 13.08,63.81 14.4,63.81 14.43,63.83 15.29,63.83 15.31,63.81 19.81,63.81 22.48,61.14 22.48,52.76 v1(24,51.23) ; v1(47.37,44.88) 47.37,32.58 H21.3
B02: length 10
  Top Layer w0.254: 14.86,57.71 14.73,57.58 H4.9
B03: length 10
  Top Layer w0.254: 14.86,55.17 14.73,55.04 H4.8
BEEP: length 63.5
  Top Layer w0.254: 14.86,60.25 14.73,60.12 H4.10
  Bottom Layer w0.254: 14.86,60.25 15.24,60.25 17.65,57.84 17.65,17.44 BUZZER.1
BIN1: length 62.9
  Top Layer w0.254: H3.14 30.1,52.63
  Bottom Layer w0.254: H3.14 44.7,52.63 47.37,55.3 56.9,55.3 60.32,51.87 60.32,32.82 H21.2
BIN2: length 38.4
  Top Layer w0.254: 30.1,45.01 H3.17
  Bottom Layer w0.254: H3.17 44.7,40.44 44.7,29.01 51.3,22.41 H21.1
BLUE: length 56.8
  Top Layer w0.254: H4.14 14.73,70.28 14.86,70.41 16.38,70.41 18.29,68.5 18.29,36.63 23.83,31.09 23.83,29.08 23.19,28.45
CL: length 99.5
  Top Layer w0.254: H4.20 14.73,85.52 14.86,85.65
  Bottom Layer w0.254: U2.3 76.71,89.71 40.51,89.71 40.33,89.89 40.33,97.13 39.62,97.84 13.59,97.84 11.81,96.06 11.81,88.7 14.86,85.65
DA: length 97.2
  Top Layer w0.254: H4.19 14.73,82.98 14.86,83.11
  Bottom Layer w0.254: U2.4 77.34,87.81 38.35,87.81 37.21,88.95 37.21,94.67 36.14,95.73 17.96,95.73 16.51,94.28 16.51,84.76 14.86,83.11
E1A: length 31.3
  Top Layer w0.254: 30.1,67.87 H3.8 40.2,67.93 42.48,67.93 44.45,65.96 44.45,61.15 H20.8
E1B: length 59
  Top Layer w0.254: H4.11 14.73,62.66 14.86,62.79 ; v1(19.3,62.66) 19.3,63.17 22.73,66.6 41.28,66.6 42.8,65.08 42.8,60.26 H20.7
  Bottom Layer w0.254: 14.86,62.79 14.99,62.66 v1(19.3,62.66)
E2A: length 46.2
  Top Layer w0.254: H20.6 55.75,51.36 55.75,65.08 52.45,68.38 44.45,68.38 42.42,70.41 H3.7 30.1,70.41
E2B: length 61.4
  Top Layer w0.254: 14.86,65.33 14.73,65.2 H4.12
  Bottom Layer w0.254: H20.5 46.49,51.49 40.66,51.49 40.62,51.45 39.64,51.45 39.61,51.49 34.8,51.49 34.62,51.67 34.62,61.19 31.75,64.06 21.84,64.06 20.7,65.2 14.99,65.2 14.86,65.33
GREEN: length 55.9
  Top Layer w0.254: H4.13 14.73,67.74 14.86,67.87
  Bottom Layer w0.254: v1(15.67,28.45) 8.76,35.35 8.76,63.68 12.95,67.87 14.86,67.87
KEY0: length 115.7
  Top Layer w0.254: CN1.3 53.09,97.71 51.94,98.86 38.54,98.86 v1(33.59,93.9) ; v1(76.31,55.31) C5.1 ; 30.1,65.33 40.13,65.33
  Bottom Layer w0.254: v1(76.31,55.31) 76.31,59.88 66.8,69.39 44.2,69.39 40.13,65.33 ; v1(33.59,93.9) 33.59,92.44 27.43,86.28 27.43,68 30.1,65.33
KEY1: length 109
  Top Layer w0.254: v1(76.31,47.04) 76.62,47.35 C1.1 ; H3.10 29.84,62.79 20.07,53.01 20.07,38.6 KEY1.1
  Bottom Layer w0.254: v1(76.31,47.04) 76.31,52.14 60.71,67.74 45.09,67.74 H3.10
KEY2: length 120.9
  Top Layer w0.254: 30.1,60.25 40.13,60.25 ; v1(76.31,39.04) 80.63,39.04 C2.1
  Bottom Layer w0.254: 40.13,60.25 40.39,60.25 46.35,66.22 58.17,66.22 72.64,51.74 72.64,42.71 v1(76.31,39.04) ; 30.1,60.25 29.72,60.25 25.15,55.68 25.15,20.39 v1(31.31,14.23)
KEY3: length 122.6
  Top Layer w0.254: v1(76.31,31.17) 80.71,31.17 C3.1 ; H3.12 28.83,57.71 21.84,50.72 21.84,40.31 34.06,28.09 34.06,25.6 31.31,22.85 KEY2.1
  Bottom Layer w0.254: H3.12 40.64,57.71 47.37,64.44 56.26,64.44 66.55,54.15 66.55,44.88 76.31,35.12 v1(76.31,31.17)
KEY4: length 133.1
  Top Layer w0.254: v1(76.31,23.48) C4.1 ; 30.1,55.17 40.13,55.17
  Bottom Layer w0.254: 30.1,55.17 29.59,55.17 27.18,52.76 27.18,36.88 33.78,30.28 33.78,10.15 v1(31.31,7.67) ; 40.13,55.17 41.02,55.17 48.51,62.66 54.36,62.66 63.63,53.39 63.63,36.17 v1(76.31,23.48)
RED: length 55.7
  Top Layer w0.254: H4.15 14.73,72.82 14.86,72.95
  Bottom Layer w0.254: v1(8.15,28.45) 7.24,29.35 7.24,70.54 H4.15
RX: length 156.8
  Top Layer w0.254: v1(28.45,37.52) 36.32,29.64 36.32,22.15 32.26,18.09 21.08,18.09 v1(19.37,19.8) ; H4.4 5.08,45.01 15.24,45.01 16.64,43.61 16.64,33.83 v1(19.18,31.29) ; v1(28.45,50.6) 29.21,51.36 46.35,51.36 50.93,46.79 56.01,46.79 59.82,50.6 59.82,67.49 57.02,70.28 52.58,70.28 U3.4
  Bottom Layer w0.254: v1(19.37,19.8) 19.37,31.1 v1(19.18,31.29) ; v1(28.45,50.6) v1(28.45,37.52)
SCL: length 57.7
  Top Layer w0.254: 14.86,78.03 14.73,77.9 H4.17 ; CN1.4 43.56,90.35 v1(20.32,90.35)
  Bottom Layer w0.254: v1(20.32,90.35) 20.32,83.49 14.86,78.03
SDA: length 54.9
  Top Layer w0.254: v1(18.42,92.38) 43.05,92.38 CN1.5 ; 14.86,80.57 14.73,80.44 H4.18
  Bottom Layer w0.254: v1(18.42,92.38) 18.42,84.12 14.86,80.57
TX: length 82.1
  Top Layer w0.254: 14.86,47.55 14.73,47.42 H4.5 4.32,47.42 3.17,48.56 3.17,71.04 3.81,71.68 4.43,71.68 4.46,71.64 17.74,71.64 25.4,79.3 41.15,79.3 41.91,78.54 U3.3
$1N1882: length 6.1
  Top Layer w0.254: RED.2 6.21,25.59 6.21,28.45
$1N1885: length 6.1
  Top Layer w0.254: BLUE.2 21.26,25.66 R9.1
$1N1887: length 6.1
  Top Layer w0.254: GREEN.2 13.74,25.62 R10.1

## Copper pours and planes (outline as drawn; the poured copper is in the pictures)
GND on Top Layer: -9.65,102.29 107.82,102.29 107.82,-3 -9.65,-3
GND on Bottom Layer: -14.22,101.78 108.08,101.78 108.08,-4.27 -14.22,-4.27

Small or netless copper shapes (teardrops, artwork), in the pictures only: 188 on Top Layer, 52 on Bottom Layer

## Text on the board
Top Silkscreen Layer: 1k | +3.3 | +5 | 10k | 100nF | GND | MSPM0G3507最小核心板 | 鼠鼠我啊 | 通信工程学院 | 陀螺仪 | OLED | 感为灰度 | AT8236稳压驱动板
